# Altium schematic sheet MIC_connection.SchDoc: Hydrophone input: 3.5 mm TRS jack with plug-in power bias
size A4; DocumentNumber: ADC-SCH-09; SheetNumber: 9; SheetTotal: 20
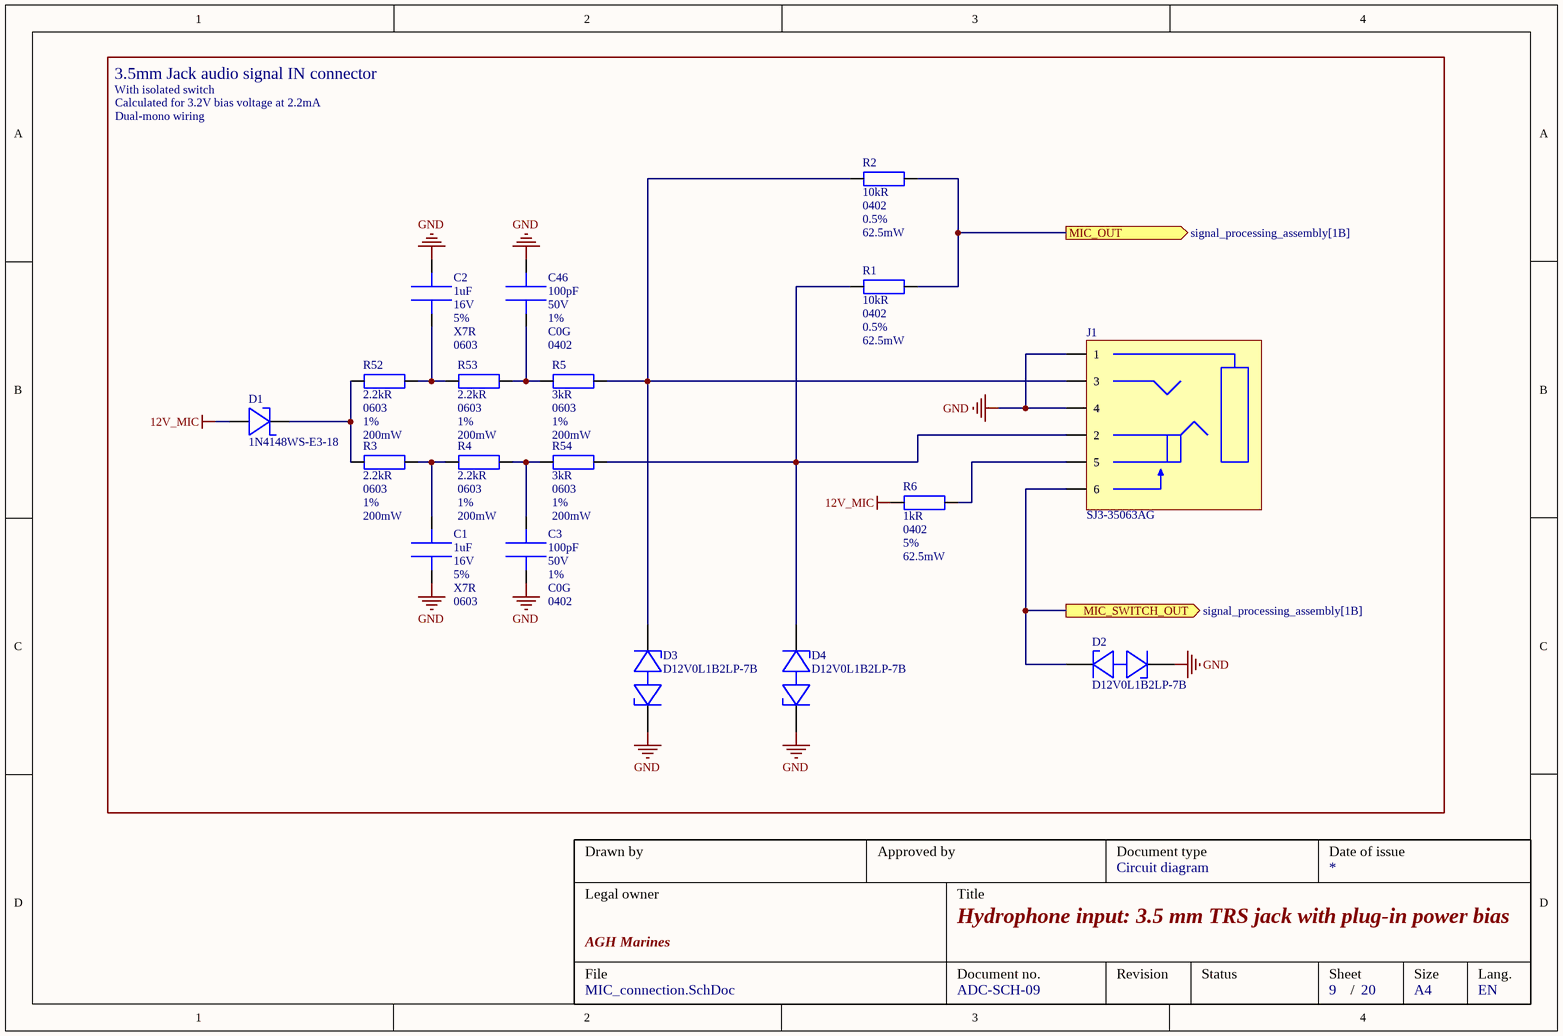
[diagram p0: MIC_connection.SchDoc]

## Parts
C1  value 1uF  Voltage: 16V  Tolerance: 5%  Dielectric: X7R  Package: 0603  [CAPC_0603]  (hidden comment: CC0603JRX7R7BB105)
C2  value 1uF  Voltage: 16V  Tolerance: 5%  Dielectric: X7R  Package: 0603  [CAPC_0603]  (hidden comment: CC0603JRX7R7BB105)
C3  value 100pF  Voltage: 50V  Tolerance: 1%  Dielectric: C0G  Package: 0402  [CAPC_0402]  (hidden comment: KGM05ACG1H101FH)
C46  value 100pF  Voltage: 50V  Tolerance: 1%  Dielectric: C0G  Package: 0402  [CAPC_0402]  (hidden comment: KGM05ACG1H101FH)
D1  1N4148WS-E3-18  [DIOC_SOD323_P]
D2  D12V0L1B2LP-7B  [DIOC_DFN-1006-2]
D3  D12V0L1B2LP-7B  [DIOC_DFN-1006-2]
D4  D12V0L1B2LP-7B  [DIOC_DFN-1006-2]
J1  SJ3-35063AG  [CONT_SJ3-35063AG]
R1  value 10kR  Package: 0402  Tolerance: 0.5%  Power: 62.5mW  [RESC_0402]  (hidden comment: AC0402DR-0710KL)
R2  value 10kR  Package: 0402  Tolerance: 0.5%  Power: 62.5mW  [RESC_0402]  (hidden comment: AC0402DR-0710KL)
R3  value 2.2kR  Package: 0603  Tolerance: 1%  Power: 200mW  [RESC_0603]  (hidden comment: AC0603FR-7W2K2L)
R4  value 2.2kR  Package: 0603  Tolerance: 1%  Power: 200mW  [RESC_0603]  (hidden comment: AC0603FR-7W2K2L)
R5  value 3kR  Package: 0603  Tolerance: 1%  Power: 200mW  [RESC_0603]  (hidden comment: RC0603FR-7W3KL)
R6  value 1kR  Package: 0402  Tolerance: 5%  Power: 62.5mW  [RESC_0402]  (hidden comment: RC0402JR-7D1KL)
R52  value 2.2kR  Package: 0603  Tolerance: 1%  Power: 200mW  [RESC_0603]  (hidden comment: AC0603FR-7W2K2L)
R53  value 2.2kR  Package: 0603  Tolerance: 1%  Power: 200mW  [RESC_0603]  (hidden comment: AC0603FR-7W2K2L)
R54  value 3kR  Package: 0603  Tolerance: 1%  Power: 200mW  [RESC_0603]  (hidden comment: RC0603FR-7W3KL)

## Ports
MIC_OUT (out, see signal_processing_assembly[1B]), MIC_SWITCH_OUT (out, see signal_processing_assembly[1B])

## Nets
12V_MIC: D1.1 R6.2
GND: C1.1 C2.1 C3.2 C46.2 D2.1 D3.1 D4.1 J1.1 J1.4
MIC_OUT: R1.2 R2.2 ; port MIC_OUT
MIC_SWITCH_OUT: D2.2 J1.6 ; port MIC_SWITCH_OUT
NetC1_2: C1.2 R3.1 R4.2
NetC2_2: C2.2 R52.2 R53.1
NetC3_1: C3.1 R4.1 R54.2
NetC46_1: C46.1 R5.2 R53.2
NetD1_2: D1.2 R3.2 R52.1
NetD3_2: D3.2 J1.3 R2.1 R5.1
NetD4_2: D4.2 J1.2 R1.1 R54.1
NetJ1_5: J1.5 R6.1

## Notes on the sheet
- 3.5mm Jack audio signal IN connector
- With isolated switch
- Calculated for 3.2V bias voltage at 2.2mA
- Dual-mono wiring
- Drawn by
- Approved by
- Document type
- Date of issue
- Legal owner
- Title
- Circuit diagram
- File
- AGH Marines
- Document no.
- Revision
- Status
- Sheet
- Size
- Lang.
- /
- A4
- EN

## Library data of the parts
C1 C2 = CC0603JRX7R7BB105: Multilayer Ceramic Capacitors MLCC - SMD/SMT 16V 1uF X7R 0603 5% HI CV; Manufacturer: YAGEO; Supplier 1: Mouser; Supplier Part Number 1: 603-CC0603JRX77BB105
C3 C46 = KGM05ACG1H101FH: Multilayer Ceramic Capacitors MLCC - SMD/SMT 50V 100pF C0G 0402 1 %; Manufacturer: KYOCERA AVX; Supplier 1: Mouser; Supplier Part Number 1: 581-04025A101F
D1 = 1N4148WS-E3-18: Small Signal Switching Diodes 100 Volt 350mA 4ns; Manufacturer: Vishay; Package: SOD-323-2; Supplier 1: Mouser; Supplier Part Number 1: 78-1N4148WS-E3-18
D2-D4 = D12V0L1B2LP-7B: ESD Protection Diodes / TVS Diodes Data Line Protection TVS Bi 13V 4A 10pF; Manufacturer: Diodes Incorporated; Voltage: 12V; Package: DFN1006-2; Capacitance: 10pF; Supplier 1: Mouser; Supplier Part Number 1: 621-D12V0L1B2LP-7B
J1 = SJ3-35063AG: Phone Connectors Audio Jack, 3.5mm, Through Hole, 3 Conductors, 1 Switches; Manufacturer: Same Sky; Supplier 1: Mouser; Supplier Part Number 1: 179-SJ3-35063AG
R1 R2 = AC0402DR-0710KL: Thick Film Resistors - SMD 10 kOhms 1/16 W 50 V 1% 0402 100 PPM / C - 55 C + 155 C AEC-Q200; Manufacturer: YAGEO; Supplier 1: Mouser; Supplier Part Number 1: 603-AC0402DR-0710KL
R3 R4 R52 R53 = AC0603FR-7W2K2L: Thick Film Resistors 2.2 kOhms 1/5 W 75 V 1% 0603 100 PPM / C - 55 C / + 155 C AEC-Q200; Manufacturer: YAGEO; Supplier 1: Mouser; Supplier Part Number 1: 603-AC0603FR-7W2K2L
R5 R54 = RC0603FR-7W3KL: Thick Film Resistors 2.2 kOhms 1/5 W 75 V 1% 0603 100 PPM / C - 55 C / + 155 C AEC-Q200; Manufacturer: YAGEO; Supplier 1: Mouser; Supplier Part Number 1: 603-RC0603FR-7W3KL
R6 = RC0402JR-7D1KL: Thick Film Resistors - SMD General Purpose Chip Resistor 0402, 1kOhms, 5%, 1/16W; Manufacturer: YAGEO; Supplier 1: Mouser; Supplier Part Number 1: 603-RC0402JR-7D1KL